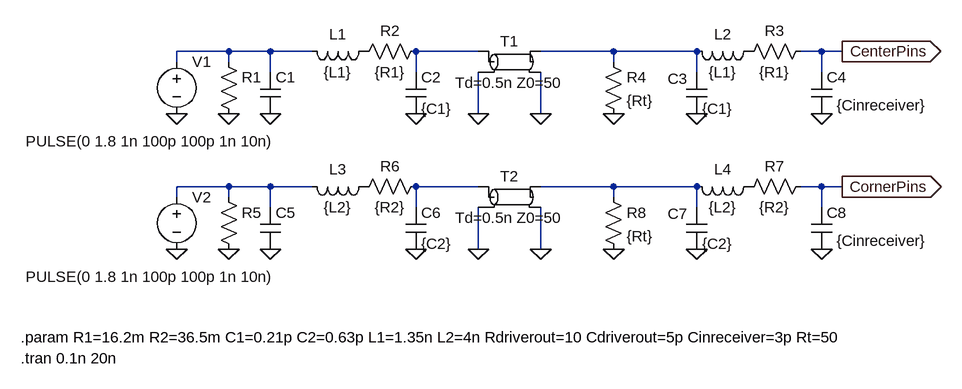
[diagram p0: schematic Exercise 6.asc]
Exercise 6.asc, the LTspice schematic file:
Version 4
SHEET 1 1644 792
WIRE 384 304 304 304
WIRE 448 304 384 304
WIRE 512 304 448 304
WIRE 768 304 672 304
WIRE 976 304 864 304
WIRE 1104 304 976 304
WIRE 1296 304 1264 304
WIRE 1328 304 1296 304
WIRE 304 320 304 304
WIRE 384 320 384 304
WIRE 976 320 976 304
WIRE 448 336 448 304
WIRE 672 336 672 304
WIRE 1104 336 1104 304
WIRE 1296 336 1296 304
WIRE 768 400 768 336
WIRE 864 400 864 336
WIRE 384 512 304 512
WIRE 448 512 384 512
WIRE 512 512 448 512
WIRE 768 512 672 512
WIRE 976 512 864 512
WIRE 1104 512 976 512
WIRE 1296 512 1264 512
WIRE 1328 512 1296 512
WIRE 304 528 304 512
WIRE 384 528 384 512
WIRE 976 528 976 512
WIRE 448 544 448 512
WIRE 672 544 672 512
WIRE 1104 544 1104 512
WIRE 1296 544 1296 512
WIRE 768 608 768 544
WIRE 864 608 864 544
FLAG 304 400 0
FLAG 384 400 0
FLAG 448 400 0
FLAG 672 400 0
FLAG 768 400 0
FLAG 864 400 0
FLAG 1104 400 0
FLAG 976 400 0
FLAG 1296 400 0
FLAG 304 608 0
FLAG 384 608 0
FLAG 448 608 0
FLAG 672 608 0
FLAG 768 608 0
FLAG 864 608 0
FLAG 1104 608 0
FLAG 976 608 0
FLAG 1296 608 0
FLAG 1328 512 CornerPins
IOPIN 1328 512 Out
FLAG 1328 304 CenterPins
IOPIN 1328 304 Out
SYMBOL Voltage 304 304 R0
WINDOW 3 -40 154 Bottom 2
SYMATTR InstName V1
SYMATTR Value PULSE(0 1.8 1n 100p 100p 1n 10n)
SYMBOL Res 368 304 R0
WINDOW 3 36 76 Invisible 2
SYMATTR InstName R1
SYMATTR Value {Rdriverout}
SYMBOL Cap 432 336 R0
WINDOW 3 24 56 Invisible 2
SYMATTR InstName C1
SYMATTR Value {Cdriverout}
SYMBOL Ind 608 288 R90
WINDOW 0 5 56 VBottom 2
WINDOW 3 32 56 VTop 2
SYMATTR InstName L1
SYMATTR Value {L1}
SYMBOL Res 688 288 R90
WINDOW 0 0 56 VBottom 2
WINDOW 3 32 56 VTop 2
SYMATTR InstName R2
SYMATTR Value {R1}
SYMBOL Cap 656 336 R0
SYMATTR InstName C2
SYMATTR Value {C1}
SYMBOL tline 816 320 R0
SYMATTR InstName T1
SYMATTR Value Td=0.5n Z0=50
SYMBOL Ind 1200 288 R90
WINDOW 0 5 56 VBottom 2
WINDOW 3 32 56 VTop 2
SYMATTR InstName L2
SYMATTR Value {L1}
SYMBOL Res 1280 288 R90
WINDOW 0 0 56 VBottom 2
WINDOW 3 32 56 VTop 2
SYMATTR InstName R3
SYMATTR Value {R1}
SYMBOL Cap 1088 336 R0
WINDOW 0 -29 10 Left 2
SYMATTR InstName C3
SYMATTR Value {C1}
SYMBOL Res 960 304 R0
SYMATTR InstName R4
SYMATTR Value {Rt}
SYMBOL Cap 1280 336 R0
WINDOW 3 39 51 Left 2
SYMATTR InstName C4
SYMATTR Value {Cinreceiver}
SYMBOL Voltage 304 512 R0
WINDOW 3 -40 154 Bottom 2
SYMATTR InstName V2
SYMATTR Value PULSE(0 1.8 1n 100p 100p 1n 10n)
SYMBOL Res 368 512 R0
WINDOW 3 36 76 Invisible 2
SYMATTR InstName R5
SYMATTR Value {Rdriverout}
SYMBOL Cap 432 544 R0
WINDOW 3 24 56 Invisible 2
SYMATTR InstName C5
SYMATTR Value {Cdriverout}
SYMBOL Ind 608 496 R90
WINDOW 0 5 56 VBottom 2
WINDOW 3 32 56 VTop 2
SYMATTR InstName L3
SYMATTR Value {L2}
SYMBOL Res 688 496 R90
WINDOW 0 0 56 VBottom 2
WINDOW 3 32 56 VTop 2
SYMATTR InstName R6
SYMATTR Value {R2}
SYMBOL Cap 656 544 R0
SYMATTR InstName C6
SYMATTR Value {C2}
SYMBOL tline 816 528 R0
SYMATTR InstName T2
SYMATTR Value Td=0.5n Z0=50
SYMBOL Ind 1200 496 R90
WINDOW 0 5 56 VBottom 2
WINDOW 3 32 56 VTop 2
SYMATTR InstName L4
SYMATTR Value {L2}
SYMBOL Res 1280 496 R90
WINDOW 0 0 56 VBottom 2
WINDOW 3 32 56 VTop 2
SYMATTR InstName R7
SYMATTR Value {R2}
SYMBOL Cap 1088 544 R0
WINDOW 0 -29 10 Left 2
SYMATTR InstName C7
SYMATTR Value {C2}
SYMBOL Res 960 512 R0
SYMATTR InstName R8
SYMATTR Value {Rt}
SYMBOL Cap 1280 544 R0
WINDOW 3 39 51 Left 2
SYMATTR InstName C8
SYMATTR Value {Cinreceiver}
TEXT 64 776 Left 2 !.tran 0.1n 20n
TEXT 64 744 Left 2 !.param R1=16.2m R2=36.5m C1=0.21p C2=0.63p L1=1.35n L2=4n Rdriverout=10 Cdriverout=5p Cinreceiver=3p Rt=50

The netlist it stands for:
* Exercise 6.asc
V1 N001 0 PULSE(0 1.8 1n 100p 100p 1n 10n)
R1 N001 0 {Rdriverout}
C1 N001 0 {Cdriverout}
L1 P001 N001 {L1}
R2 N002 P001 {R1}
C2 N002 0 {C1}
T1 N002 0 N003 0 Td=0.5n Z0=50
L2 P002 N003 {L1}
R3 CenterPins P002 {R1}
C3 N003 0 {C1}
R4 N003 0 {Rt}
C4 CenterPins 0 {Cinreceiver}
V2 N004 0 PULSE(0 1.8 1n 100p 100p 1n 10n)
R5 N004 0 {Rdriverout}
C5 N004 0 {Cdriverout}
L3 P003 N004 {L2}
R6 N005 P003 {R2}
C6 N005 0 {C2}
T2 N005 0 N006 0 Td=0.5n Z0=50
L4 P004 N006 {L2}
R7 CornerPins P004 {R2}
C7 N006 0 {C2}
R8 N006 0 {Rt}
C8 CornerPins 0 {Cinreceiver}
.tran 0.1n 20n
.param R1=16.2m R2=36.5m C1=0.21p C2=0.63p L1=1.35n L2=4n Rdriverout=10 Cdriverout=5p Cinreceiver=3p Rt=50
.backanno
.end